# Altium schematic sheet Connector.SchDoc
size A4; SheetNumber: 3; SheetTotal: 3
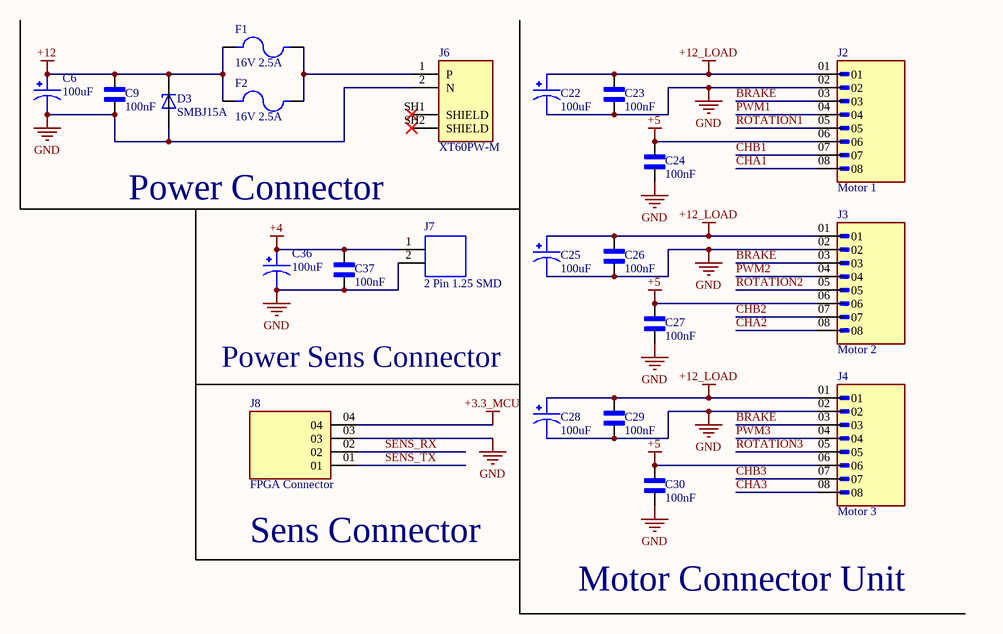
[diagram p0: Connector.SchDoc]

## Parts
C6  100uF  [CAPAE830X1000N]
C9  100nF  [CAPC1608X90N]
C22  100uF  [CAPAE830X1000N]
C23  100nF  [CAPC1608X90N]
C24  100nF  [CAPC1608X90N]
C25  100uF  [CAPAE830X1000N]
C26  100nF  [CAPC1608X90N]
C27  100nF  [CAPC1608X90N]
C28  100uF  [CAPAE830X1000N]
C29  100nF  [CAPC1608X90N]
C30  100nF  [CAPC1608X90N]
C36  100uF  [CAPAE830X1000N]
C37  100nF  [CAPC1608X90N]
D3  SMBJ15A  [DIOM4336X265N]
F1  16V 2.5A  [FUSER_MF-MSMF250/16X-2]
F2  16V 2.5A  [FUSER_MF-MSMF250/16X-2]
J2  Motor 1  [PHOENIX_1803484]
J3  Motor 2  [PHOENIX_1803484]
J4  Motor 3  [PHOENIX_1803484]
J6  XT60PW-M  [AMASS_XT60PW-M]
J7  2 Pin 1.25 SMD  [CONN_532610001-SD_02_MOL]
J8  FPGA Connector  [SAMTEC_TSW-104-07-T-S-LL]

## Nets
+3.3_MCU: J8.04
+4: C36.1 C37.2 J7.1
+5: C24.2 C27.2 C30.2 J2.06 J3.06 J4.06
+12: C6.1 C9.2 D3.C F1.1 F2.1
+12_LOAD: C22.1 C23.2 C25.1 C26.2 C28.1 C29.2 J2.01 J3.01 J4.01
GND: C6.2 C9.1 C22.2 C23.1 C24.1 C25.2 C26.1 C27.1 C28.2 C29.1 C30.1 C36.2 C37.1 D3.A J2.02 J3.02 J4.02 J6.2(N) J7.2 J8.03
BRAKE: J2.03 J3.03 J4.03
CHA1: J2.08
CHA2: J3.08
CHA3: J4.08
CHB1: J2.07
CHB2: J3.07
CHB3: J4.07
PWM1: J2.04
PWM2: J3.04
PWM3: J4.04
ROTATION1: J2.05
ROTATION2: J3.05
ROTATION3: J4.05
SENS_RX: J8.02
SENS_TX: J8.01
NetF1_2: F1.2 F2.2 J6.1(P)

Not connected (* = marked no-connect by the designer): J6 SH1(SHIELD)* SH2(SHIELD)*

## Notes on the sheet
- Power Connector
- Power Sens Connector
- (near J8) Sens Connector
- Motor Connector Unit

## Library data of the parts
C6 C22 C25 C28 C36 = UWT1V101MCL1GS: Capacitor Aluminum Electrolytic, 1000h 6.3 (Dia.) x 7.7mm, 100uF, 35V, WT Series | Nichicon UWT1V101MCL1GS; SnapEDA_Link: https://www.snapeda.com/parts/UWT1V101MCL1GS/Nichicon/view-part/?ref=snap; Package: Radial Nichicon; Value: *; MF: Nichicon; MP: UWT1V101MCL1GS; Check_prices: https://www.snapeda.com/parts/UWT1V101MCL1GS/Nichicon/view-part/?ref=eda
C9 C23 C24 C26 C27 C29 C30 C37 = GRM188R71H104KA93D: SMD Capacitor X7R(EIA) with Capacitance: 0.10uF Tol. 10%. Rated Voltage: 50Vdc; MF: Murata; SnapEDA_Link: https://www.snapeda.com/parts/GRM188R71H104KA93D/Murata/view-part/?ref=snap; Package: 1608 Murata; Value: *; MP: GRM188R71H104KA93D; Check_prices: https://www.snapeda.com/parts/GRM188R71H104KA93D/Murata/view-part/?ref=eda
D3 = SMBJ15A: 600W, 17.6V, 5%, Unidirectional, TVS; MF: Taiwan Semiconductor; SnapEDA_Link: https://www.snapeda.com/parts/SMBJ15A/taiwan/view-part/?ref=snap; Package: SMD-2 Taiwan Semiconductor; Value: *; MP: SMBJ15A; Check_prices: https://www.snapeda.com/parts/SMBJ15A/taiwan/view-part/?ref=eda
F1 F2 = MF-MSMF250/16X-2: Polymeric PTC Resettable Fuse 16V 2.5 A Ih Surface Mount 1812 (4532 Metric), Concave; MF: Bourns; Availability: In Stock; SnapEDA_Link: https://www.snapeda.com/parts/MF-MSMF250/16X-2/Bourns/view-part/?ref=snap; Price: None; Check_prices: https://www.snapeda.com/parts/MF-MSMF250/16X-2/Bourns/view-part/?ref=eda; Package: 1812 Bourns; MP: MF-MSMF250/16X-2; Purchase-URL: https://pricing.snapeda.com/search/part/MF-MSMF250/16X-2/?ref=eda; Value: *
J2-J4 = 1803484: MF: {'manufacturer': u'Phoenix Contact'}; Package: None; Price: None; Value: *; MP: 1803484; Availability: Unavailable
J6 = XT60PW-M: Socket, DC supply, male, PIN: 2; MF: AMASS; SnapEDA_Link: https://www.snapeda.com/parts/XT60PW-M/AMASS/view-part/?ref=snap; Package: Package; Value: *; MP: XT60PW-M; Check_prices: https://www.snapeda.com/parts/XT60PW-M/AMASS/view-part/?ref=eda
J7 = 532610271: Connector Header Surface Mount, Right Angle 2 position 0.049 (1.25mm); MF: Molex; SnapEDA_Link: https://www.snapeda.com/parts/532610271/Molex/view-part/?ref=snap; Package: None; Value: *; MP: 532610271; Check_prices: https://www.snapeda.com/parts/532610271/Molex/view-part/?ref=eda
J8 = TSW-104-07-T-S-LL: Availability: Unavailable; Price: None; MP: TSW-104-07-T-S-LL; Package: None; Value: *